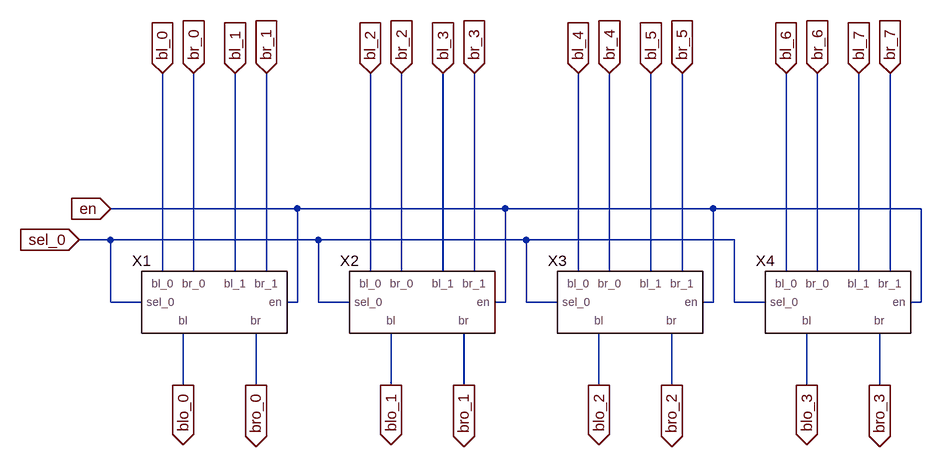
[diagram p0: schematic column_mux.asc]
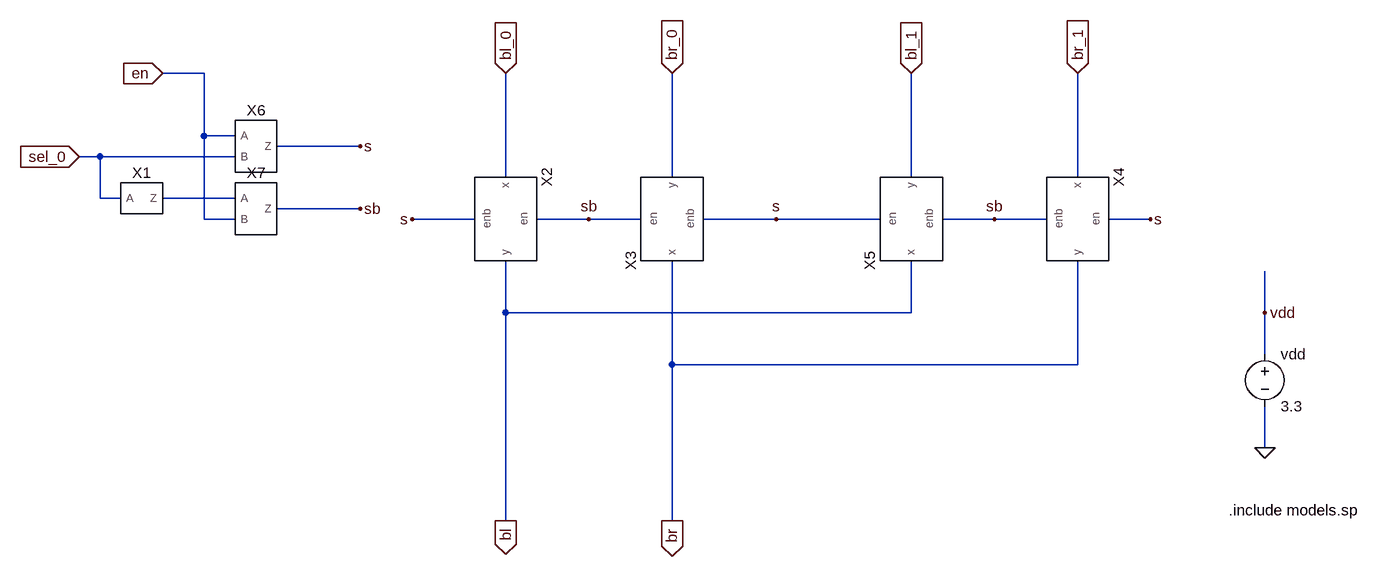
[diagram p1: sub-circuit mux21.asc]
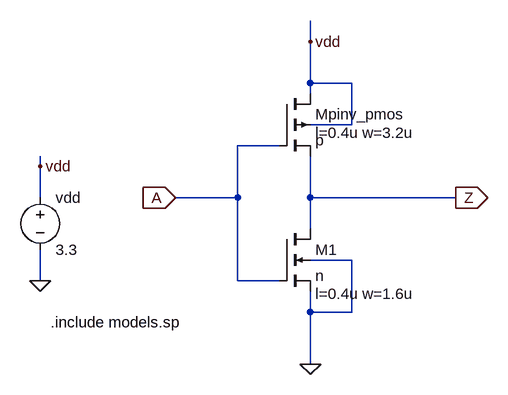
[diagram p2: sub-circuit inv.asc]
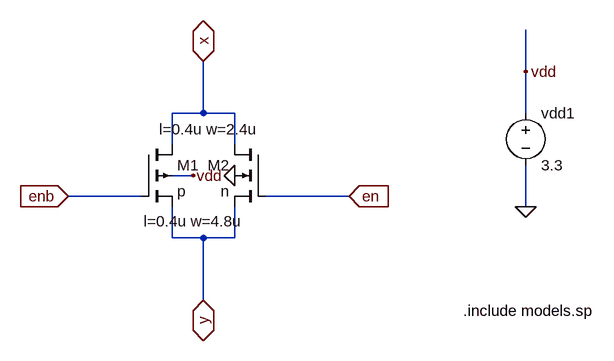
[diagram p3: sub-circuit tri_gate.asc]
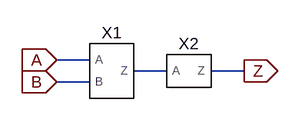
[diagram p4: sub-circuit and2.asc]
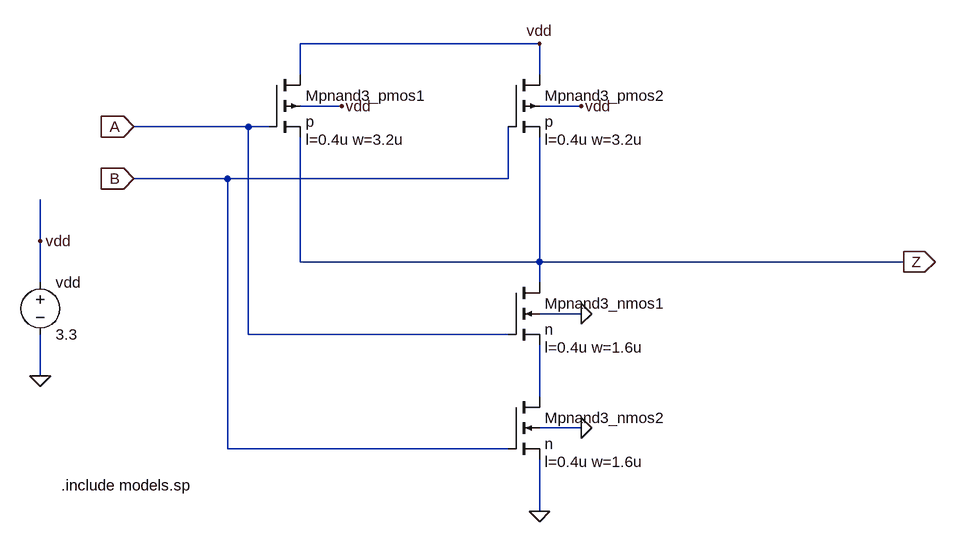
[diagram p5: sub-circuit nand2.asc]
column_mux.asc, the LTspice schematic file:
Version 4
SHEET 1 1144 680
WIRE 144 48 -144 48
WIRE 464 48 144 48
WIRE 784 48 464 48
WIRE 1104 48 784 48
WIRE -144 96 -192 96
WIRE 176 96 -144 96
WIRE 496 96 176 96
WIRE 816 96 496 96
WIRE -64 144 -64 -160
WIRE -16 144 -16 -160
WIRE 48 144 48 -160
WIRE 96 144 96 -160
WIRE 256 144 256 -160
WIRE 304 144 304 -160
WIRE 368 144 368 -160
WIRE 416 144 416 -160
WIRE 576 144 576 -160
WIRE 624 144 624 -160
WIRE 688 144 688 -160
WIRE 736 144 736 -160
WIRE 896 144 896 -160
WIRE 944 144 944 -160
WIRE 1008 144 1008 -160
WIRE 1056 144 1056 -160
WIRE -144 192 -144 96
WIRE -96 192 -144 192
WIRE 144 192 144 48
WIRE 144 192 128 192
WIRE 176 192 176 96
WIRE 224 192 176 192
WIRE 464 192 464 48
WIRE 464 192 448 192
WIRE 496 192 496 96
WIRE 544 192 496 192
WIRE 784 192 784 48
WIRE 784 192 768 192
WIRE 816 192 816 96
WIRE 864 192 816 192
WIRE 1104 192 1104 48
WIRE 1104 192 1088 192
WIRE -32 320 -32 240
WIRE 80 320 80 240
WIRE 288 320 288 240
WIRE 400 320 400 240
WIRE 608 320 608 240
WIRE 720 320 720 240
WIRE 928 320 928 240
WIRE 1040 320 1040 240
FLAG -64 -160 bl_0
IOPIN -64 -160 In
FLAG 48 -160 bl_1
IOPIN 48 -160 In
FLAG -16 -160 br_0
IOPIN -16 -160 In
FLAG 96 -160 br_1
IOPIN 96 -160 In
FLAG -32 320 blo_0
IOPIN -32 320 Out
FLAG 80 320 bro_0
IOPIN 80 320 Out
FLAG 256 -160 bl_2
IOPIN 256 -160 In
FLAG 368 -160 bl_3
IOPIN 368 -160 In
FLAG 304 -160 br_2
IOPIN 304 -160 In
FLAG 416 -160 br_3
IOPIN 416 -160 In
FLAG 288 320 blo_1
IOPIN 288 320 Out
FLAG 400 320 bro_1
IOPIN 400 320 Out
FLAG 576 -160 bl_4
IOPIN 576 -160 In
FLAG 688 -160 bl_5
IOPIN 688 -160 In
FLAG 624 -160 br_4
IOPIN 624 -160 In
FLAG 736 -160 br_5
IOPIN 736 -160 In
FLAG 608 320 blo_2
IOPIN 608 320 Out
FLAG 720 320 bro_2
IOPIN 720 320 Out
FLAG 896 -160 bl_6
IOPIN 896 -160 In
FLAG 1008 -160 bl_7
IOPIN 1008 -160 In
FLAG 944 -160 br_6
IOPIN 944 -160 In
FLAG 1056 -160 br_7
IOPIN 1056 -160 In
FLAG 928 320 blo_3
IOPIN 928 320 Out
FLAG 1040 320 bro_3
IOPIN 1040 320 Out
FLAG -192 96 sel_0
IOPIN -192 96 In
FLAG -144 48 en
IOPIN -144 48 In
SYMBOL mux21 16 176 R0
WINDOW 0 -112 -32 Bottom 2
SYMATTR InstName X1
SYMBOL mux21 336 176 R0
WINDOW 0 -112 -32 Bottom 2
SYMATTR InstName X2
SYMBOL mux21 656 176 R0
WINDOW 0 -112 -32 Bottom 2
SYMATTR InstName X3
SYMBOL mux21 976 176 R0
WINDOW 0 -112 -32 Bottom 2
SYMATTR InstName X4

mux21.asc, the sub-circuit schematic file:
Version 4
SHEET 1 1808 680
WIRE 16 -192 -48 -192
WIRE 16 -96 16 -192
WIRE 64 -96 16 -96
WIRE 256 -80 128 -80
WIRE -144 -64 -176 -64
WIRE 64 -64 -144 -64
WIRE 480 -32 480 -192
WIRE 736 -32 736 -192
WIRE 1104 -32 1104 -192
WIRE 1360 -32 1360 -192
WIRE -144 0 -144 -64
WIRE -112 0 -144 0
WIRE 64 0 -48 0
WIRE 256 16 128 16
WIRE 16 32 16 -96
WIRE 64 32 16 32
WIRE 432 32 336 32
WIRE 608 32 528 32
WIRE 688 32 608 32
WIRE 896 32 784 32
WIRE 1056 32 896 32
WIRE 1232 32 1152 32
WIRE 1312 32 1232 32
WIRE 1472 32 1408 32
WIRE 480 176 480 96
WIRE 1104 176 1104 96
WIRE 1104 176 480 176
WIRE 1648 176 1648 112
WIRE 1648 240 1648 176
WIRE 736 256 736 96
WIRE 1360 256 1360 96
WIRE 1360 256 736 256
WIRE 1648 384 1648 320
WIRE 480 496 480 176
WIRE 736 496 736 256
FLAG 1648 384 0
FLAG 1648 176 vdd
FLAG -176 -64 sel_0
IOPIN -176 -64 In
FLAG 480 -192 bl_0
IOPIN 480 -192 In
FLAG 736 -192 br_0
IOPIN 736 -192 In
FLAG 1104 -192 bl_1
IOPIN 1104 -192 In
FLAG 1360 -192 br_1
IOPIN 1360 -192 In
FLAG 480 496 bl
IOPIN 480 496 Out
FLAG 736 496 br
IOPIN 736 496 Out
FLAG 256 16 sb
FLAG 256 -80 s
FLAG 896 32 s
FLAG 1232 32 sb
FLAG 1472 32 s
FLAG 608 32 sb
FLAG 336 32 s
FLAG -48 -192 en
IOPIN -48 -192 In
SYMBOL voltage 1648 224 R0
WINDOW 123 0 0 Left 0
WINDOW 39 0 0 Left 0
SYMATTR InstName vdd
SYMATTR Value 3.3
SYMBOL inv -80 0 R0
SYMATTR InstName X1
SYMBOL tri_gate 480 32 R90
SYMATTR InstName X2
SYMBOL tri_gate 736 32 R270
SYMATTR InstName X3
SYMBOL tri_gate 1360 32 R90
SYMATTR InstName X4
SYMBOL tri_gate 1104 32 R270
SYMATTR InstName X5
SYMBOL and2 96 -80 R0
SYMATTR InstName X6
SYMBOL nand2 96 16 R0
SYMATTR InstName X7
TEXT 1592 480 Left 2 !.include models.sp

inv.asc, the sub-circuit schematic file:
Version 4
SHEET 1 880 680
WIRE 112 -128 112 -160
WIRE 112 -64 112 -128
WIRE 176 -64 112 -64
WIRE 112 -48 112 -64
WIRE 176 0 176 -64
WIRE 176 0 112 0
WIRE 64 32 0 32
WIRE -304 64 -304 48
WIRE -304 112 -304 64
WIRE 0 112 0 32
WIRE 0 112 -96 112
WIRE 112 112 112 48
WIRE 336 112 112 112
WIRE 112 160 112 112
WIRE 176 208 112 208
WIRE -304 240 -304 192
WIRE 0 240 0 112
WIRE 64 240 0 240
WIRE 112 288 112 256
WIRE 176 288 176 208
WIRE 176 288 112 288
WIRE 112 368 112 288
FLAG -96 112 A
IOPIN -96 112 In
FLAG 336 112 Z
IOPIN 336 112 Out
FLAG 112 368 0
FLAG -304 240 0
FLAG 112 -128 vdd
FLAG -304 64 vdd
SYMBOL nmos4 64 160 R0
WINDOW 123 56 100 Left 2
SYMATTR Value2 l=0.4u w=1.6u
SYMATTR InstName M1
SYMATTR Value n
SYMBOL pmos4 64 -48 R0
WINDOW 123 56 60 Left 2
SYMATTR Value2 l=0.4u w=3.2u
SYMATTR InstName Mpinv_pmos
SYMATTR Value p
SYMBOL voltage -304 96 R0
SYMATTR InstName vdd
SYMATTR Value 3.3
TEXT -288 304 Left 2 !.include models.sp

tri_gate.asc, the sub-circuit schematic file:
Version 4
SHEET 1 880 680
WIRE 576 -16 576 -80
WIRE 80 48 80 -32
WIRE 80 48 32 48
WIRE 128 48 80 48
WIRE 576 48 576 -16
WIRE 32 96 32 48
WIRE 128 96 128 48
WIRE 64 144 32 144
WIRE -16 176 -128 176
WIRE 304 176 176 176
WIRE 576 192 576 128
WIRE 32 240 32 192
WIRE 80 240 32 240
WIRE 128 240 128 192
WIRE 128 240 80 240
WIRE 80 336 80 240
FLAG 128 144 0
FLAG 64 144 vdd
FLAG 576 192 0
FLAG 576 -16 vdd
FLAG 80 336 y
IOPIN 80 336 BiDir
FLAG 80 -32 x
IOPIN 80 -32 BiDir
FLAG 304 176 en
IOPIN 304 176 In
FLAG -128 176 enb
IOPIN -128 176 In
SYMBOL pmos4 -16 96 R0
WINDOW 123 4 118 Left 2
SYMATTR Value2 l=0.4u w=4.8u
SYMATTR InstName M1
SYMATTR Value p
SYMBOL nmos4 176 96 M0
WINDOW 123 12 -23 Left 2
SYMATTR Value2 l=0.4u w=2.4u
SYMATTR InstName M2
SYMATTR Value n
SYMBOL voltage 576 32 R0
WINDOW 123 0 0 Left 0
WINDOW 39 0 0 Left 0
SYMATTR InstName vdd1
SYMATTR Value 3.3
TEXT 480 352 Left 2 !.include models.sp

and2.asc, the sub-circuit schematic file:
Version 4
SHEET 1 880 680
WIRE 48 96 0 96
WIRE 160 112 112 112
WIRE 272 112 224 112
WIRE 48 128 0 128
FLAG 0 96 A
IOPIN 0 96 In
FLAG 0 128 B
IOPIN 0 128 In
FLAG 272 112 Z
IOPIN 272 112 Out
SYMBOL inv 192 112 R0
SYMATTR InstName X2
SYMBOL nand2 80 112 R0
SYMATTR InstName X1

nand2.asc, the sub-circuit schematic file:
Version 4
SHEET 1 1192 1028
WIRE 560 128 192 128
WIRE 192 176 192 128
WIRE 560 176 560 128
WIRE 256 224 192 224
WIRE 624 224 560 224
WIRE 112 256 -64 256
WIRE 144 256 112 256
WIRE 80 336 -64 336
WIRE 512 336 512 256
WIRE 512 336 80 336
WIRE -208 432 -208 368
WIRE 192 464 192 272
WIRE 560 464 560 272
WIRE 560 464 192 464
WIRE 1120 464 560 464
WIRE -208 496 -208 432
WIRE 560 496 560 464
WIRE 624 544 560 544
WIRE 112 576 112 256
WIRE 512 576 112 576
WIRE -208 640 -208 576
WIRE 560 672 560 592
WIRE 624 720 560 720
WIRE 80 752 80 336
WIRE 512 752 80 752
WIRE 560 848 560 768
FLAG -64 256 A
IOPIN -64 256 In
FLAG -64 336 B
IOPIN -64 336 In
FLAG 1120 464 Z
IOPIN 1120 464 Out
FLAG -208 640 0
FLAG 624 544 0
FLAG 624 720 0
FLAG -208 432 vdd
FLAG 256 224 vdd
FLAG 624 224 vdd
FLAG 560 848 0
FLAG 560 128 vdd
SYMBOL pmos4 144 176 R0
WINDOW 123 56 100 Left 2
SYMATTR Value2 l=0.4u w=3.2u
SYMATTR InstName Mpnand3_pmos1
SYMATTR Value p
SYMBOL pmos4 512 176 R0
WINDOW 123 56 100 Left 2
SYMATTR Value2 l=0.4u w=3.2u
SYMATTR InstName Mpnand3_pmos2
SYMATTR Value p
SYMBOL nmos4 512 496 R0
WINDOW 123 56 100 Left 2
SYMATTR Value2 l=0.4u w=1.6u
SYMATTR InstName Mpnand3_nmos1
SYMATTR Value n
SYMBOL nmos4 512 672 R0
WINDOW 123 56 100 Left 2
SYMATTR Value2 l=0.4u w=1.6u
SYMATTR InstName Mpnand3_nmos2
SYMATTR Value n
SYMBOL voltage -208 480 R0
WINDOW 123 0 0 Left 0
WINDOW 39 0 0 Left 0
SYMATTR InstName vdd
SYMATTR Value 3.3
TEXT -176 808 Left 2 !.include models.sp

The netlist it stands for:
* column_mux.asc
XX1 bl_0 bl_1 br_0 br_1 sel_0 blo_0 bro_0 en mux21
XX2 bl_2 bl_3 br_2 br_3 sel_0 blo_1 bro_1 en mux21
XX3 bl_4 bl_5 br_4 br_5 sel_0 blo_2 bro_2 en mux21
XX4 bl_6 bl_7 br_6 br_7 sel_0 blo_3 bro_3 en mux21

* block symbol definitions
.subckt mux21 bl_0 bl_1 br_0 br_1 sel_0 bl br en
vdd vdd 0 3.3
XX1 sel_0 N001 inv
XX2 sb s bl_0 bl tri_gate
XX3 sb s br br_0 tri_gate
XX4 s sb br_1 br tri_gate
XX5 s sb bl bl_1 tri_gate
XX6 en sel_0 s and2
XX7 N001 en sb nand2
.include models.sp
.ends mux21

.subckt inv A Z
M1 Z A 0 0 n l=0.4u w=1.6u
Mpinv_pmos vdd A Z vdd p l=0.4u w=3.2u
vdd vdd 0 3.3
.include models.sp
.ends inv

.subckt tri_gate en enb x y
M1 x enb y vdd p l=0.4u w=4.8u
M2 x en y 0 n l=0.4u w=2.4u
vdd1 vdd 0 3.3
.include models.sp
.ends tri_gate

.subckt and2 A B Z
XX2 N001 Z inv
XX1 A B N001 nand2
.ends and2

.subckt nand2 A B Z
Mpnand3_pmos1 vdd A Z vdd p l=0.4u w=3.2u
Mpnand3_pmos2 vdd B Z vdd p l=0.4u w=3.2u
Mpnand3_nmos1 Z A N001 0 n l=0.4u w=1.6u
Mpnand3_nmos2 N001 B 0 0 n l=0.4u w=1.6u
vdd vdd 0 3.3
.include models.sp
.ends nand2

.model NMOS NMOS
.model PMOS PMOS
.lib standard.mos
.backanno
.end